# Altium schematic sheet System_Top.SchDoc
size A4; SheetNumber: 1; SheetTotal: 5
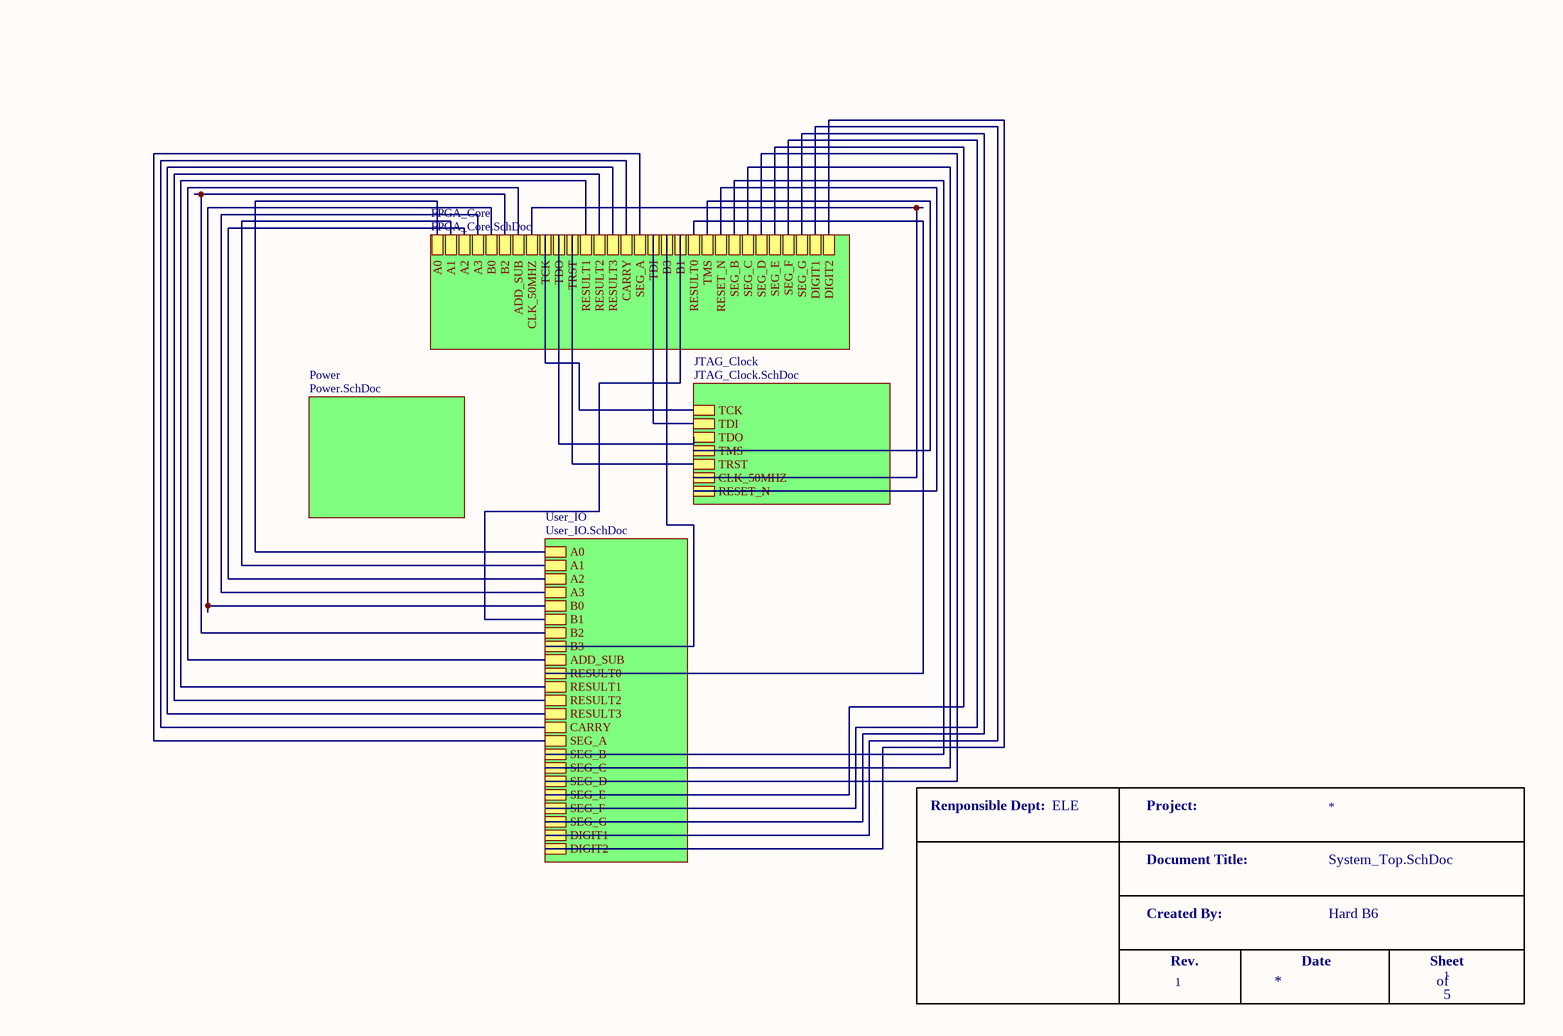
[diagram p0: System_Top.SchDoc]

## Parts
*  HSHL Title Block  (value not drawn)  (graphical)

## Sub-sheets
FPGA_Core = FPGA_Core.SchDoc: A0, A1, A2, A3, B0, B2, ADD_SUB, CLK_50MHZ, TCK, TDO, TRST, RESULT1, RESULT2, RESULT3, CARRY, SEG_A, TDI, B3, B1, RESULT0, TMS, RESET_N, SEG_B, SEG_C, SEG_D, SEG_E, SEG_F, SEG_G, DIGIT1, DIGIT2
JTAG_Clock = JTAG_Clock.SchDoc: TCK, TDI, TDO, TMS, TRST, CLK_50MHZ, RESET_N
Power = Power.SchDoc: no entries
User_IO = User_IO.SchDoc: A0, A1, A2, A3, B0, B1, B2, B3, ADD_SUB, RESULT0, RESULT1, RESULT2, RESULT3, CARRY, SEG_A, SEG_B, SEG_C, SEG_D, SEG_E, SEG_F, SEG_G, DIGIT1, DIGIT2

## Nets
(unnamed): sheet FPGA_Core/A0, sheet User_IO/A0
(unnamed): sheet FPGA_Core/A1, sheet User_IO/A1
(unnamed): sheet FPGA_Core/A2, sheet User_IO/A2
(unnamed): sheet FPGA_Core/A3, sheet User_IO/A3
(unnamed): sheet FPGA_Core/B0, sheet User_IO/B0
(unnamed): sheet FPGA_Core/B2, sheet User_IO/B2
(unnamed): sheet FPGA_Core/ADD_SUB, sheet User_IO/ADD_SUB
(unnamed): sheet FPGA_Core/CLK_50MHZ, sheet JTAG_Clock/CLK_50MHZ
(unnamed): sheet FPGA_Core/TCK, sheet JTAG_Clock/TCK
(unnamed): sheet FPGA_Core/TDO, sheet JTAG_Clock/TDO
(unnamed): sheet FPGA_Core/TRST, sheet JTAG_Clock/TRST
(unnamed): sheet FPGA_Core/RESULT1, sheet User_IO/RESULT1
(unnamed): sheet FPGA_Core/RESULT2, sheet User_IO/RESULT2
(unnamed): sheet FPGA_Core/RESULT3, sheet User_IO/RESULT3
(unnamed): sheet FPGA_Core/CARRY, sheet User_IO/CARRY
(unnamed): sheet FPGA_Core/SEG_A, sheet User_IO/SEG_A
(unnamed): sheet FPGA_Core/TDI, sheet JTAG_Clock/TDI
(unnamed): sheet FPGA_Core/B3, sheet User_IO/B3
(unnamed): sheet FPGA_Core/B1, sheet User_IO/B1
(unnamed): sheet FPGA_Core/RESULT0, sheet User_IO/RESULT0
(unnamed): sheet FPGA_Core/TMS, sheet JTAG_Clock/TMS
(unnamed): sheet FPGA_Core/RESET_N, sheet JTAG_Clock/RESET_N
(unnamed): sheet FPGA_Core/SEG_B, sheet User_IO/SEG_B
(unnamed): sheet FPGA_Core/SEG_C, sheet User_IO/SEG_C
(unnamed): sheet FPGA_Core/SEG_D, sheet User_IO/SEG_D
(unnamed): sheet FPGA_Core/SEG_E, sheet User_IO/SEG_E
(unnamed): sheet FPGA_Core/SEG_F, sheet User_IO/SEG_F
(unnamed): sheet FPGA_Core/SEG_G, sheet User_IO/SEG_G
(unnamed): sheet FPGA_Core/DIGIT1, sheet User_IO/DIGIT1
(unnamed): sheet FPGA_Core/DIGIT2, sheet User_IO/DIGIT2

## Notes on the sheet
- DWG. NO.
- REV.
- SHT.
- THIS DOCUMENT AND THE DATA DISCLOSED HEREIN OR HEREWITH IS THE PROPERTY OF ALTIUM LIMITED AND MAY BE FREELY DISTRIBUTED IN WHOLE. NO RIGHTS ARE RESERVED OR EXPRESS OR IMPLIED WARANTEE GIVEN.
- REVISION
- DESCRIPTION
- DATE
- APPROVED
- ENG:
- APPROVALS
- PROJECT
- DSN:
- CHK:
- REFERENCE DOCUMENTS
- PROJECT REVISION:
- TITLE
- DOCUMENT REVISION:
- DESIGN ITEM:
- BOM:
- FAB DWG:
- PCB DWG:
- ASSY DWG:
- SCALE:
- SIZE
- B
- CAGE CODE
- FILE NAME
- DWG NO.
- SHEET
- OF
- REV
- (in symbol HSHL Title Block) Renponsible Dept:; ELE; Project:; Document Title:; Created By:; Hard B6; Rev.; Date; Sheet; 1; of